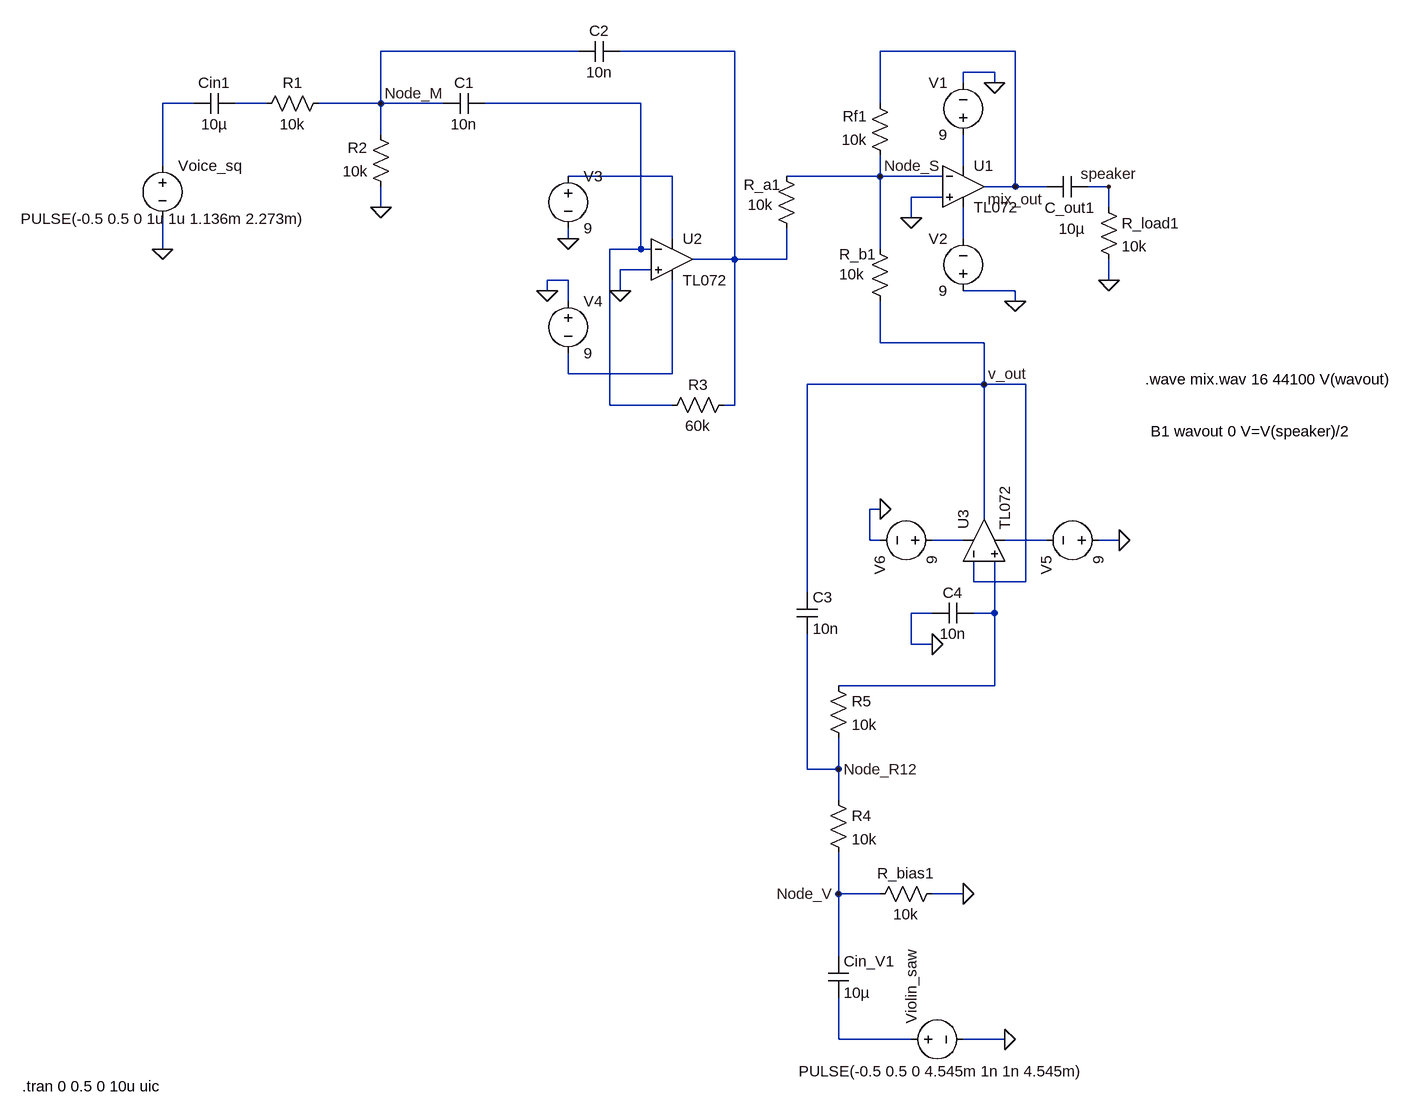
[diagram p0: schematic final.asc]
final.asc, the LTspice schematic file:
Version 4.1
SHEET 1 1272 1592
WIRE -256 -16 -560 -16
WIRE -16 -16 -192 -16
WIRE 416 -16 208 -16
WIRE 384 16 336 16
WIRE 336 32 336 16
WIRE 384 32 384 16
WIRE -848 64 -896 64
WIRE -736 64 -784 64
WIRE -560 64 -560 -16
WIRE -560 64 -656 64
WIRE -464 64 -560 64
WIRE -160 64 -400 64
WIRE 208 64 208 -16
WIRE -560 112 -560 64
WIRE -896 160 -896 64
WIRE 336 160 336 112
WIRE -112 176 -272 176
WIRE 208 176 208 144
WIRE 208 176 64 176
WIRE 304 176 208 176
WIRE 416 192 416 -16
WIRE 416 192 368 192
WIRE 464 192 416 192
WIRE 560 192 528 192
WIRE 304 208 256 208
WIRE -560 224 -560 192
WIRE 560 224 560 192
WIRE 256 240 256 208
WIRE -272 272 -272 256
WIRE -112 272 -112 176
WIRE 336 272 336 224
WIRE -896 288 -896 240
WIRE -160 288 -160 64
WIRE -160 288 -208 288
WIRE -144 288 -160 288
WIRE 208 288 208 176
WIRE -16 304 -16 -16
WIRE -16 304 -80 304
WIRE 64 304 64 256
WIRE 64 304 -16 304
WIRE -144 320 -192 320
WIRE -272 336 -304 336
WIRE 560 336 560 304
WIRE -304 352 -304 336
WIRE -192 352 -192 320
WIRE 416 352 336 352
WIRE -272 368 -272 336
WIRE 416 368 416 352
WIRE 208 432 208 368
WIRE 368 432 208 432
WIRE -272 480 -272 448
WIRE -112 480 -112 336
WIRE -112 480 -272 480
WIRE 368 496 368 432
WIRE 368 496 96 496
WIRE 432 496 368 496
WIRE -208 528 -208 288
WIRE -112 528 -208 528
WIRE -16 528 -16 304
WIRE -16 528 -32 528
WIRE 208 688 192 688
WIRE 368 704 368 496
WIRE 192 736 192 688
WIRE 208 736 192 736
WIRE 336 736 288 736
WIRE 464 736 400 736
WIRE 576 736 544 736
WIRE 352 800 352 768
WIRE 432 800 432 496
WIRE 432 800 352 800
WIRE 96 816 96 496
WIRE 288 848 256 848
WIRE 384 848 384 768
WIRE 384 848 352 848
WIRE 256 896 256 848
WIRE 288 896 256 896
WIRE 384 960 384 848
WIRE 384 960 144 960
WIRE 96 1088 96 880
WIRE 144 1088 144 1040
WIRE 144 1088 96 1088
WIRE 144 1136 144 1088
WIRE 144 1280 144 1216
WIRE 208 1280 144 1280
WIRE 336 1280 288 1280
WIRE 144 1376 144 1280
WIRE 144 1504 144 1440
WIRE 256 1504 144 1504
WIRE 400 1504 336 1504
FLAG 384 32 0
FLAG 416 368 0
FLAG 256 240 0
FLAG 208 176 Node_S
FLAG 416 192 mix_out
FLAG 560 336 0
FLAG 560 192 speaker
FLAG -560 224 0
FLAG -896 288 0
FLAG -192 352 0
FLAG -272 272 0
FLAG -304 352 0
FLAG -560 64 Node_M
FLAG 400 1504 0
FLAG 336 1280 0
FLAG 144 1280 Node_V
FLAG 144 1088 Node_R12
FLAG 288 896 0
FLAG 208 688 0
FLAG 576 736 0
FLAG 368 496 v_out
SYMBOL TL072 336 128 R0
SYMATTR InstName U1
SYMBOL voltage 336 128 R180
WINDOW 0 24 96 Left 2
WINDOW 3 24 16 Left 2
WINDOW 123 0 0 Left 0
WINDOW 39 0 0 Left 0
SYMATTR InstName V1
SYMATTR Value 9
SYMBOL voltage 336 368 R180
WINDOW 0 24 96 Left 2
WINDOW 3 24 16 Left 2
WINDOW 123 0 0 Left 0
WINDOW 39 0 0 Left 0
SYMATTR InstName V2
SYMATTR Value 9
SYMBOL res 48 160 R0
WINDOW 0 8 29 Right 2
WINDOW 3 -44 60 Left 2
SYMATTR InstName R_a1
SYMATTR Value 10k
SYMBOL res 192 272 R0
WINDOW 0 -47 24 Left 2
WINDOW 3 -47 55 Left 2
SYMATTR InstName R_b1
SYMATTR Value 10k
SYMBOL res 224 160 R180
WINDOW 0 36 76 Left 2
WINDOW 3 36 40 Left 2
SYMATTR InstName Rf1
SYMATTR Value 10k
SYMBOL cap 528 176 R90
WINDOW 0 64 28 VBottom 2
WINDOW 3 65 25 VTop 2
SYMATTR InstName C_out1
SYMATTR Value 10µ
SYMBOL res 544 208 R0
SYMATTR InstName R_load1
SYMATTR Value 10k
SYMBOL cap -784 48 R90
WINDOW 0 0 32 VBottom 2
WINDOW 3 32 32 VTop 2
SYMATTR InstName Cin1
SYMATTR Value 10µ
SYMBOL res -640 48 R90
WINDOW 0 0 56 VBottom 2
WINDOW 3 32 56 VTop 2
SYMATTR InstName R1
SYMATTR Value 10k
SYMBOL res -544 208 R180
WINDOW 0 36 76 Left 2
WINDOW 3 36 40 Left 2
SYMATTR InstName R2
SYMATTR Value 10k
SYMBOL cap -400 48 R90
WINDOW 0 0 32 VBottom 2
WINDOW 3 32 32 VTop 2
SYMATTR InstName C1
SYMATTR Value 10n
SYMBOL TL072 -112 240 R0
SYMATTR InstName U2
SYMBOL voltage -896 144 R0
WINDOW 123 24 124 Left 2
WINDOW 39 0 0 Left 0
WINDOW 3 -218 97 Left 2
SYMATTR InstName Voice_sq
SYMATTR Value PULSE(-0.5 0.5 0 1u 1u 1.136m 2.273m)
SYMBOL voltage -272 160 R0
WINDOW 123 0 0 Left 0
WINDOW 39 0 0 Left 0
SYMATTR InstName V3
SYMATTR Value 9
SYMBOL voltage -272 352 R0
WINDOW 123 0 0 Left 0
WINDOW 39 0 0 Left 0
SYMATTR InstName V4
SYMATTR Value 9
SYMBOL cap -192 -32 R90
WINDOW 0 0 32 VBottom 2
WINDOW 3 32 32 VTop 2
SYMATTR InstName C2
SYMATTR Value 10n
SYMBOL res -16 512 R90
WINDOW 0 0 56 VBottom 2
WINDOW 3 32 56 VTop 2
SYMATTR InstName R3
SYMATTR Value 60k
SYMBOL TL072 304 736 R270
SYMATTR InstName U3
SYMBOL voltage 240 1504 R270
WINDOW 123 24 72 Left 2
WINDOW 39 0 0 Left 0
WINDOW 3 -49 -157 VRight 2
SYMATTR Value PULSE(-0.5 0.5 0 4.545m 1n 1n 4.545m)
SYMATTR InstName Violin_saw
SYMBOL cap 128 1376 R0
SYMATTR InstName Cin_V1
SYMATTR Value 10µ
SYMBOL res 192 1296 R270
WINDOW 0 32 56 VTop 2
WINDOW 3 0 56 VBottom 2
SYMATTR InstName R_bias1
SYMATTR Value 10k
SYMBOL res 128 1120 R0
SYMATTR InstName R4
SYMATTR Value 10k
SYMBOL res 128 944 R0
SYMATTR InstName R5
SYMATTR Value 10k
SYMBOL cap 80 816 R0
SYMATTR InstName C3
SYMATTR Value 10n
SYMBOL cap 288 864 R270
WINDOW 0 32 32 VTop 2
WINDOW 3 0 32 VBottom 2
SYMATTR InstName C4
SYMATTR Value 10n
SYMBOL voltage 560 736 R90
WINDOW 0 24 96 Left 2
WINDOW 3 24 16 Left 2
WINDOW 123 0 0 Left 0
WINDOW 39 0 0 Left 0
SYMATTR InstName V5
SYMATTR Value 9
SYMBOL voltage 304 736 R90
WINDOW 0 24 96 Left 2
WINDOW 3 24 16 Left 2
WINDOW 123 0 0 Left 0
WINDOW 39 0 0 Left 0
SYMATTR InstName V6
SYMATTR Value 9
TEXT 616 488 Left 2 !.wave mix.wav 16 44100 V(wavout)
TEXT -1112 1576 Left 2 !.tran 0 0.5 0 10u uic
TEXT 624 568 Left 2 !B1 wavout 0 V=V(speaker)/2

The netlist it stands for:
* final.asc
* U1: TL072 (symbol TL072 not available, pins judged from their places): In+=0 In-=Node_S V+=N005 V-=N007 OUT=mix_out
V1 N005 0 9
V2 0 N007 9
R_a1 Node_S N001 10k
R_b1 Node_S v_out 10k
Rf1 Node_S mix_out 10k
C_out1 speaker mix_out 10µ
R_load1 speaker 0 10k
Cin1 N003 N002 10µ
R1 Node_M N003 10k
R2 0 Node_M 10k
C1 N004 Node_M 10n
* U2: TL072 (symbol TL072 not available, pins judged from their places): In+=0 In-=N004 V+=N006 V-=N008 OUT=N001
Voice_sq N002 0 PULSE(-0.5 0.5 0 1u 1u 1.136m 2.273m)
V3 N006 0 9
V4 0 N008 9
C2 N001 Node_M 10n
R3 N001 N004 60k
* U3: TL072 (symbol TL072 not available, pins judged from their places): In+=N011 In-=v_out V+=N009 V-=N010 OUT=v_out
Violin_saw N012 0 PULSE(-0.5 0.5 0 4.545m 1n 1n 4.545m)
Cin_V1 Node_V N012 10µ
R_bias1 Node_V 0 10k
R4 Node_R12 Node_V 10k
R5 N011 Node_R12 10k
C3 v_out Node_R12 10n
C4 0 N011 10n
V5 0 N010 9
V6 N009 0 9
.wave mix.wav 16 44100 V(wavout)
.tran 0 0.5 0 10u uic
B1 wavout 0 V=V(speaker)/2
.backanno
.end